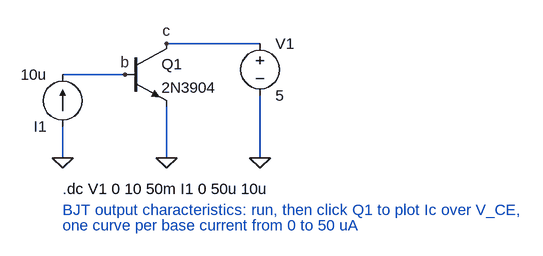
[diagram p0: schematic bjt_curves.asc]
bjt_curves.asc, the LTspice schematic file:
Version 4
SHEET 1 880 680
WIRE 96 144 192 144
WIRE 256 96 400 96
WIRE 256 192 256 272
WIRE 400 176 400 272
WIRE 96 224 96 272
FLAG 96 272 0
FLAG 256 272 0
FLAG 400 272 0
FLAG 192 144 b
FLAG 256 96 c
SYMBOL current 96 224 R180
SYMATTR InstName I1
SYMATTR Value 10u
SYMBOL npn 192 96 R0
SYMATTR InstName Q1
SYMATTR Value 2N3904
SYMBOL voltage 400 80 R0
SYMATTR InstName V1
SYMATTR Value 5
TEXT 96 320 Left 2 !.dc V1 0 10 50m I1 0 50u 10u
TEXT 96 352 Left 2 ;BJT output characteristics: run, then click Q1 to plot Ic over V_CE,
TEXT 96 376 Left 2 ;one curve per base current from 0 to 50 uA

The netlist it stands for:
* bjt_curves.asc
I1 0 b 10u
Q1 c b 0 0 2N3904
V1 c 0 5
.model NPN NPN
.model PNP PNP
.lib standard.bjt
.dc V1 0 10 50m I1 0 50u 10u
* BJT output characteristics: run, then click Q1 to plot Ic over V_CE,
* one curve per base current from 0 to 50 uA
.backanno
.end